# EasyEDA Pro project YT9215S-5-port-switch.epro, schematic schematic1

## Sheets
1 P1: Create Date: 2023-09-12; Page Name: P1; Project Name: 基于裕太微YT9215S的五口千兆交换机; Schematic Name: schematic1; Update Date: 2023-09-12; Company: 嘉立创EDA; Page Size: A2; Version: V1.0
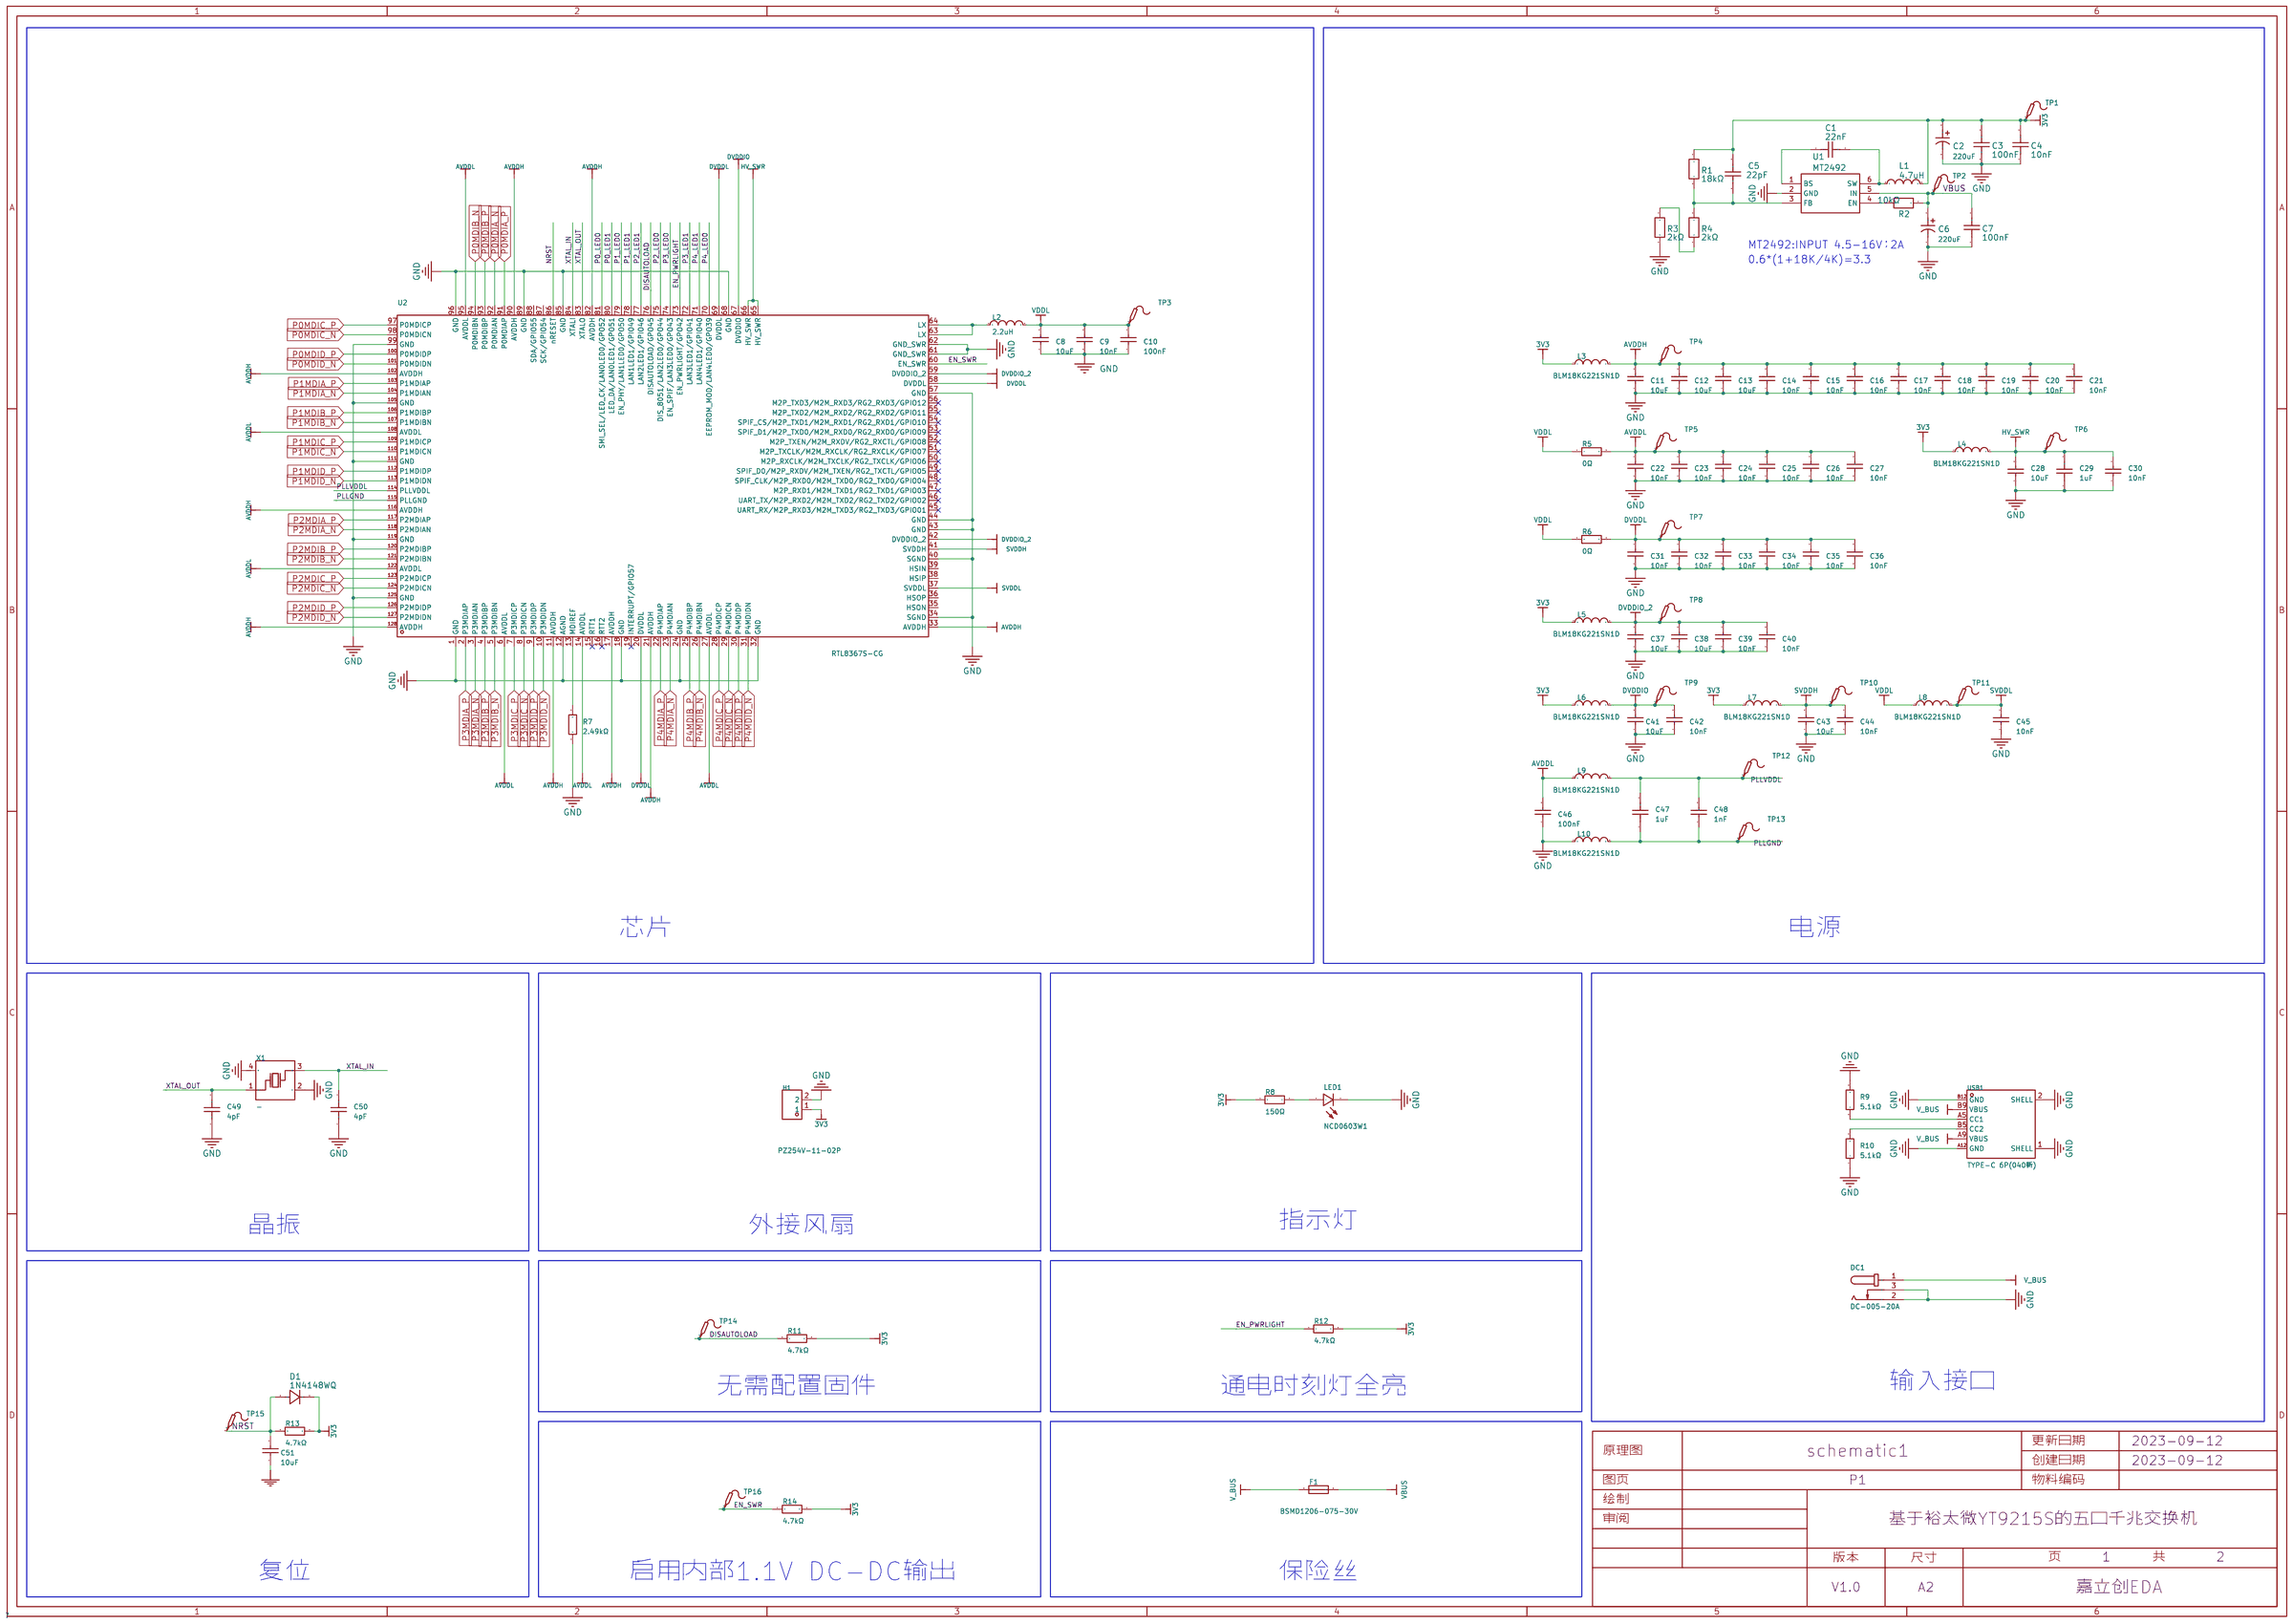
[diagram p0: P1]
2 P2: Page Name: P2
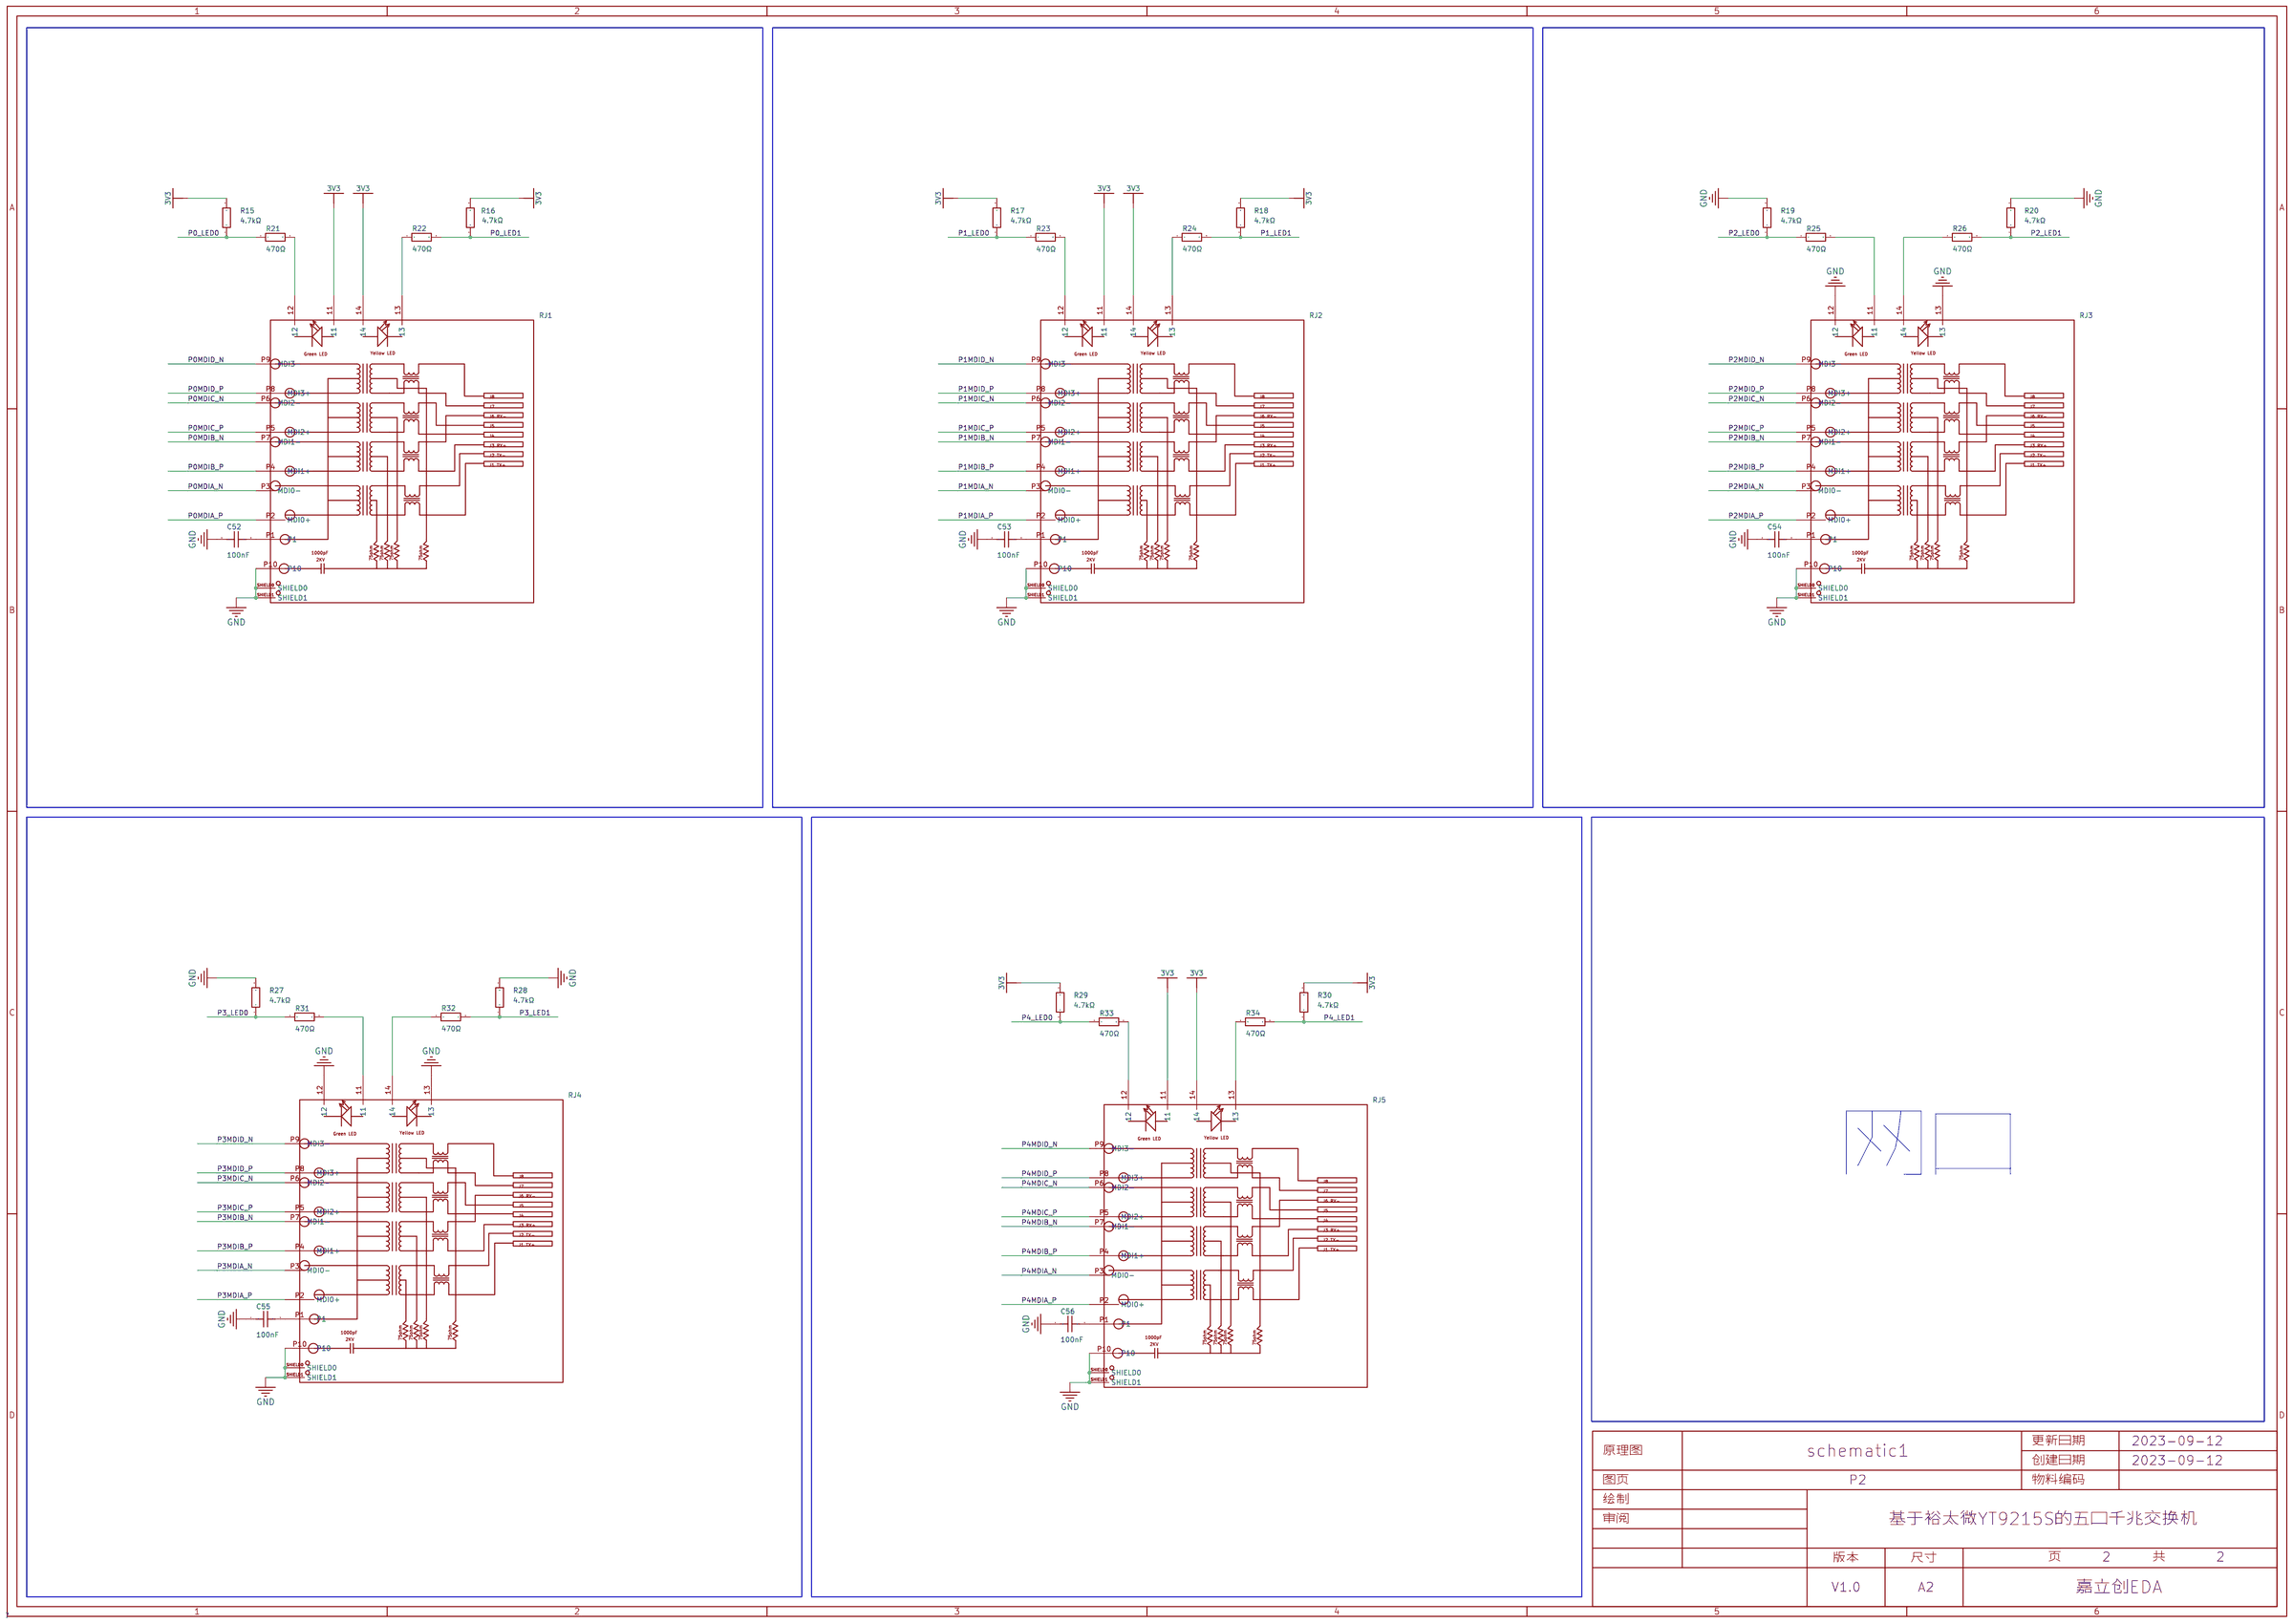
[diagram p1: P2]

## Parts
sheet P1
C1  22nF  [C0402]
C2  220uF  [CAP-SMD_BD6.3-L6.6-W6.6-LS7.4-FD]
C3  100nF  [C0402]
C4  10nF  [C0402]
C5  22pF  [C0402]
C6  220uF  [CAP-SMD_BD6.3-L6.6-W6.6-LS7.4-FD]
C7  100nF  [C0402]
C8  10uF  [C0805]
C9  10nF  [C0603]
C10  100nF  [C0603]
C11  10uF  [C0805]
C12  10uF  [C0805]
C13  10uF  [C0805]
C14  10nF  [C0603]
C15  10nF  [C0603]
C16  10nF  [C0603]
C17  10nF  [C0603]
C18  10nF  [C0603]
C19  10nF  [C0603]
C20  10nF  [C0603]
C21  10nF  [C0603]
C22  10nF  [C0603]
C23  10nF  [C0603]
C24  10nF  [C0603]
C25  10nF  [C0603]
C26  10nF  [C0603]
C27  10nF  [C0603]
C28  10uF  [C0805]
C29  1uF  [C0603]
C30  10nF  [C0603]
C31  10nF  [C0603]
C32  10nF  [C0603]
C33  10nF  [C0603]
C34  10nF  [C0603]
C35  10nF  [C0603]
C36  10nF  [C0603]
C37  10uF  [C0805]
C38  10uF  [C0805]
C39  10nF  [C0603]
C40  10nF  [C0603]
C41  10uF  [C0805]
C42  10nF  [C0603]
C43  10uF  [C0805]
C44  10nF  [C0603]
C45  10nF  [C0603]
C46  100nF  [C0603]
C47  1uF  [C0603]
C48  1nF  [C0603]
C49  4pF  [C0603]
C50  4pF  [C0603]
C51  10uF  [C0805]
D1  1N4148WQ  [SOD-123_L2.7-W1.6-LS3.7-RD-1]
DC1  DC-005-20A  [DC-IN-TH_DC-005-20A]
F1  BSMD1206-075-30V  [F1206]
H1  PZ254V-11-02P  [HDR-TH_2P-P2.54-V-M]
L1  4.7uH  [IND-SMD_L4.0-W4.0]
L2  2.2uH  [IND-SMD_L4.0-W4.0_SWPA4018S]
L3  BLM18KG221SN1D  [L0603]
L4  BLM18KG221SN1D  [L0603]
L5  BLM18KG221SN1D  [L0603]
L6  BLM18KG221SN1D  [L0603]
L7  BLM18KG221SN1D  [L0603]
L8  BLM18KG221SN1D  [L0603]
L9  BLM18KG221SN1D  [L0603]
L10  BLM18KG221SN1D  [L0603]
LED1  NCD0603W1  [LED0603-RD]
R1  18kΩ  [R0402]
R2  10kΩ  [R0402]
R3  2kΩ  [R0402]
R4  2kΩ  [R0402]
R5  0Ω  [R1206]
R6  0Ω  [R1206]
R7  2.49kΩ  [R0402]
R8  150Ω  [R0603]
R9  5.1kΩ  [R0603]
R10  5.1kΩ  [R0603]
R11  4.7kΩ  [R0603]
R12  4.7kΩ  [R0603]
R13  4.7kΩ  [R0603]
R14  4.7kΩ  [R0603]
TP1  -  [Test-Point-0.5mm]
TP2  -  [Test-Point-0.5mm]
TP3  -  [Test-Point-0.5mm]
TP4  -  [Test-Point-0.5mm]
TP5  -  [Test-Point-0.5mm]
TP6  -  [Test-Point-0.5mm]
TP7  -  [Test-Point-0.5mm]
TP8  -  [Test-Point-0.5mm]
TP9  -  [Test-Point-0.5mm]
TP10  -  [Test-Point-0.5mm]
TP11  -  [Test-Point-0.5mm]
TP12  -  [Test-Point-0.5mm]
TP13  -  [Test-Point-0.5mm]
TP14  -  [Test-Point-0.5mm]
TP15  -  [Test-Point-0.5mm]
TP16  -  [Test-Point-0.5mm]
U1  MT2492  [SOT-23-6_L2.9-W1.6-P0.95-LS2.8-BL]
U2  RTL8367S-CG  [LQFP-128_L14.0-W14.0-P0.40-LS16.0-BL]
USB1  TYPE-C 6P(040新)  [USB-C-SMD_TYPE-C-6P]
X1  -  [CRYSTAL-SMD_4P-L2.0-W1.6-BL]
sheet P2
C52  100nF  [C0402]
C53  100nF  [C0402]
C54  100nF  [C0402]
C55  100nF  [C0402]
C56  100nF  [C0402]
R15  4.7kΩ  [R0402]
R16  4.7kΩ  [R0402]
R17  4.7kΩ  [R0402]
R18  4.7kΩ  [R0402]
R19  4.7kΩ  [R0402]
R20  4.7kΩ  [R0402]
R21  470Ω  [R0402]
R22  470Ω  [R0402]
R23  470Ω  [R0402]
R24  470Ω  [R0402]
R25  470Ω  [R0402]
R26  470Ω  [R0402]
R27  4.7kΩ  [R0402]
R28  4.7kΩ  [R0402]
R29  4.7kΩ  [R0402]
R30  4.7kΩ  [R0402]
R31  470Ω  [R0402]
R32  470Ω  [R0402]
R33  470Ω  [R0402]
R34  470Ω  [R0402]
RJ1  HR911130A  [RJ45-TH_HR911130A]
RJ2  HR911130A  [RJ45-TH_HR911130A]
RJ3  HR911130A  [RJ45-TH_HR911130A]
RJ4  HR911130A  [RJ45-TH_HR911130A]
RJ5  HR911130A  [RJ45-TH_HR911130A]

## Library data of the parts
C1 = 0402B223K500NT: 容值:22nF;精度:±10%;额定电压:50V;材质(温度系数):X7R;; LCSC Part Name: 22nF ±10% 50V; Supplier Part: C1532; Manufacturer: FH(风华); Supplier Footprint: 0402; JLCPCB Part Class: Basic Part; Datasheet: https://atta.szlcsc.com/upload/public/pdf/source/20200305/C486355_26A10D38EF8C2A5C37091D0039909270.pdf; Supplier: LCSC; Tolerance: ±10%; Voltage Rated: 50V; Temperature Coefficient: X7R
C2 C6 = RVT1E221M0607: 容值:220uF;精度:±20%;额定电压:25V;纹波电流:150mA@120Hz;等效串联电阻:-;; LCSC Part Name: 220uF ±20% 25V; Supplier Part: C2918361; Manufacturer: ROQANG(容强); Supplier Footprint: SMD,D6.3xL7.7mm; JLCPCB Part Class: 扩展库; Datasheet: https://atta.szlcsc.com/upload/public/pdf/source/20211118/497C0614266278696CA52BDF245B991F.pdf; Supplier: LCSC; Tolerance: ±20%; Rated Voltage: 25V; φD: 6.3mm; L: 7.7mm; Ripple Current: 150mA@120Hz; Operating Temperature: -40℃~+105℃
C3 C7 = CL05B104KO5NNNC: 容值:100nF;精度:±10%;额定电压:16V;材质(温度系数):X7R;; LCSC Part Name: 100nF ±10% 16V; Supplier Part: C1525; Manufacturer: SAMSUNG(三星); Supplier Footprint: 0402; JLCPCB Part Class: Basic Part; Datasheet: https://atta.szlcsc.com/upload/public/pdf/source/20160103/1457707674891.pdf; Supplier: LCSC; Tolerance: ±10%; Voltage Rated: 16V; Temperature Coefficient: X7R
C4 = CL05B103KB5NNNC: 容值:10nF;精度:±10%;额定电压:50V;材质(温度系数):X7R;; LCSC Part Name: 10nF ±10% 50V; Supplier Part: C15195; Manufacturer: SAMSUNG(三星); Supplier Footprint: 0402; JLCPCB Part Class: Basic Part; Datasheet: https://atta.szlcsc.com/upload/public/pdf/source/20160103/1457707674468.pdf; Supplier: LCSC; Tolerance: ±10%; Voltage Rated: 50V; Temperature Coefficient: X7R
C5 = 0402CG220J500NT: 容值:22pF;精度:±5%;额定电压:50V;材质(温度系数):C0G;; LCSC Part Name: 22pF ±5% 50V; Supplier Part: C1555; Manufacturer: FH(风华); Supplier Footprint: 0402; JLCPCB Part Class: Basic Part; Datasheet: https://atta.szlcsc.com/upload/public/pdf/source/20200305/C486355_26A10D38EF8C2A5C37091D0039909270.pdf; Supplier: LCSC; Tolerance: ±5%; Voltage Rated: 50V; Temperature Coefficient: C0G
C8 C11-C13 C28 C37 C38 C41 C43 C51 = 0805X106K250NT: 容值:10uF;精度:±10%;额定电压:25V;材质(温度系数):X5R;; LCSC Part Name: 10uF ±10% 25V; Supplier Part: C40894; Manufacturer: FH(风华); Supplier Footprint: 0805; JLCPCB Part Class: 扩展库; Datasheet: https://atta.szlcsc.com/upload/public/pdf/source/20170923/C40894_1506149452994988759.pdf; Supplier: LCSC; Tolerance: ±10%; Voltage Rated: 25V; Temperature Coefficient: X5R
C9 C14-C27 C30-C36 C39 C40 C42 C44 C45 = 0603B103K500NT: 容值:10nF;精度:±10%;额定电压:50V;材质(温度系数):X7R;; LCSC Part Name: 10nF ±10% 50V; Supplier Part: C57112; Manufacturer: FH(风华); Supplier Footprint: 0603; JLCPCB Part Class: 基础库; Datasheet: https://atta.szlcsc.com/upload/public/pdf/source/20170923/C57112_1506149495135988846.pdf; Supplier: LCSC; Tolerance: ±10%; Voltage Rated: 50V; Temperature Coefficient: X7R
C10 C46 = 0603B104K500NT: 容值:100nF;精度:±10%;额定电压:50V;材质(温度系数):X7R;; LCSC Part Name: 100nF ±10% 50V; Supplier Part: C30926; Manufacturer: FH(风华); Supplier Footprint: 0603; JLCPCB Part Class: 扩展库; Datasheet: https://atta.szlcsc.com/upload/public/pdf/source/20170923/C30926_1506149436298988724.pdf; Supplier: LCSC; Tolerance: ±10%; Voltage Rated: 50V; Temperature Coefficient: X7R
C29 C47 = 0603B105K500NT: 温度系数:X7R;精度:±10%;额定电压:50V;容值:1uF;; LCSC Part Name: 1uF(105) ±10% 50V; Supplier Part: C90540; Manufacturer: FH(风华); Supplier Footprint: 0603; JLCPCB Part Class: 扩展库; Datasheet: https://atta.szlcsc.com/upload/public/pdf/source/20170923/C90540_1506149560830988967.pdf; Supplier: LCSC; Temperature Coefficient: X7R; Tolerance: ±10%; Voltage Rated: 50V
C48 = 0603B102K500NT: 容值:1nF;精度:±10%;额定电压:50V;材质(温度系数):X7R;; LCSC Part Name: 1nF ±10% 50V; Supplier Part: C44369; Manufacturer: FH(风华); Supplier Footprint: 0603; JLCPCB Part Class: 扩展库; Datasheet: https://atta.szlcsc.com/upload/public/pdf/source/20170923/C44369_1506149462708988780.pdf; Supplier: LCSC; Tolerance: ±10%; Voltage Rated: 50V; Temperature Coefficient: X7R
C49 C50 = 0603CG4R0B500NT: 容值:4pF;额定电压:50V;材质(温度系数):C0G;; LCSC Part Name: 4pF 50V ±0.1pF; Supplier Part: C507053; Manufacturer: FH(风华); Supplier Footprint: 0603; JLCPCB Part Class: 扩展库; Datasheet: https://atta.szlcsc.com/upload/public/pdf/source/20200305/C486355_26A10D38EF8C2A5C37091D0039909270.pdf; Supplier: LCSC; Voltage Rated: 50V; Temperature Coefficient: C0G
D1 = 1N4148WQ: LCSC Part Name: 车规级; Supplier Part: C2942441; Manufacturer: YANGJIE(扬杰); Supplier Footprint: SOD-123; JLCPCB Part Class: Extended Part; Datasheet: https://atta.szlcsc.com/upload/public/pdf/source/20220505/FBE89F3A747E9227B0A9D8340B8A7F4C.pdf; Supplier: LCSC
DC1 = DC-005-20A_C136744: 触点内径:2mm;触点外径:6.4mm;额定电流:500mA;额定电压:30V;; LCSC Part Name: DC-005-20A  内芯2.0mm 全铜; Supplier Part: C136744; Manufacturer: 韩国韩荣; Supplier Footprint: 插件; JLCPCB Part Class: 扩展库; Datasheet: https://atta.szlcsc.com/upload/public/pdf/source/20210810/D1FE451D887B1804F0660F580C4AD849.pdf; Supplier: LCSC; Inside Contact Diameter: 2mm; Outside Contact Diameter: 6.4mm; Current Rating (Max): 500mA; Voltage Rating (Max): 30V
F1 = BSMD1206-075-30V: 最大电压:30V;最大电流:40A;保持电流:750mA;跳闸电流:1.5A;消耗功率:600mW;初始态阻值(最小值):90mΩ;跳断后阻值(最大值):500mΩ;最大动作时间:200ms;工作温度:-40℃~+85℃;; LCSC Part Name: 1206 0.75A 30V 佰宏高电压; Supplier Part: C976305; Manufacturer: BHFUSE(佰宏); Supplier Footprint: 1206; JLCPCB Part Class: 扩展库; Datasheet: https://atta.szlcsc.com/upload/public/pdf/source/20220607/BE3D288249A8A8FEF08AA69BF9FC830E.pdf; Supplier: LCSC; Operating Voltage (Max): 30V; Current Rating (Max): 40A; Hold Current: 750mA; Trip Current: 1.5A; Power Dissipation: 600mW; Resistance - Initial (Ri) (Min): 90mΩ; Resistance - Post Trip (R1) (Max): 500mΩ; Maximum Time to Trip: 200ms; Operating Temperature: -40℃~+85℃
H1 = PZ254V-11-02P: 排数:单排;总PIN位数:2P;间距:2.54mm;插针结构:1x2P;行距:-;安装类型:直插;圆针/方针:方针;额定电流:-;额定电压:-;配合针长度:6mm;塑高:2.5mm;端接针长度:3mm;触头材质:黄铜;触头镀层:-;工作温度范围:-40℃~+105℃;颜色:黑色;; LCSC Part Name: 2.54mm 1x2P 直插 方针; Supplier Part: C492401; Manufacturer: XFCN(兴飞); Supplier Footprint: 插件,P=2.54mm; JLCPCB Part Class: 扩展库; Datasheet: https://atta.szlcsc.com/upload/public/pdf/source/20200309/C492401_A812433581A9B211A7FFA413ADDFF0E5.pdf; Supplier: LCSC; Number of Rows: 单排; Number of Pins: 2P; Pitch: 2.54mm; Pin Structure: 1x2P; Mounting Type: 直插; Circluar Pins/Square Pins: 方针; Length of Mating Pin: 6mm; Insulation Height: 2.5mm; Length of End Connection Pin: 3mm; Contact Material: 黄铜; Operating Temperature Range: -40℃~+105℃; Color: 黑色
L1 = SWPA4030S4R7MT: 直流电阻(DCR):78mΩ;精度:±20%;电感值:4.7uH;额定电流:2A;; LCSC Part Name: 4.7uH ±20%; Supplier Part: C57269; Manufacturer: Sunlord(顺络); Supplier Footprint: SMD; JLCPCB Part Class: Extended Part; Datasheet: https://atta.szlcsc.com/upload/public/pdf/source/20161024/1477287957557.pdf; Supplier: LCSC; DC Resistance (DCR): 78mΩ; Tolerance: ±20%; Height: 3mm; Width: 4mm; Rated Current: 2A; Length: 4mm
L2 = SWPA4018S2R2MT: 类型:-;电感值:2.2uH;精度:±20%;额定电流:1.65A;饱和电流(Isat):3.2A;; LCSC Part Name: 2.2uH ±20% 3.2A; Supplier Part: C50543; Manufacturer: Sunlord(顺络); Supplier Footprint: SMD; JLCPCB Part Class: 扩展库; Datasheet: https://atta.szlcsc.com/upload/public/pdf/source/20210916/AC798BA7E846B7D0B6818F45CD84DB0B.pdf; Supplier: LCSC; Tolerance: ±20%; Rated Current: 1.65A; Saturation Current (Isat): 3.2A; DC Resistance (DCR): 45mΩ
L3-L10 = BLM18KG221SN1D: 标称阻抗@测试频率:220Ω@100MHz;误差:±25%;直流电阻(RDC):50mΩ;; LCSC Part Name: 单路 0603磁珠 阻抗220Ω@100MHz; Supplier Part: C88980; Manufacturer: muRata(村田); Supplier Footprint: 0603; JLCPCB Part Class: 扩展库; Datasheet: https://atta.szlcsc.com/upload/public/pdf/source/20180326/C88980_2C536F2328F49D4DFD71B8DED243E2BA.pdf; Supplier: LCSC; Impedance @ Frequency: 220Ω@100MHz; Tolerance: ±25%; DC Resistance: 50mΩ; Current Rating: 2.2A; Circuits: 1
LED1 = NCD0603W1: 发光颜色:白灯;; Supplier Part: C84265; Manufacturer: 国星光电; Supplier Footprint: 0603; JLCPCB Part Class: 扩展库; Datasheet: https://atta.szlcsc.com/upload/public/pdf/source/20200820/C84265_479E6193713348A548E5CD6D9278BF16.pdf; Supplier: LCSC; Emitted Color: 白灯
R1 = 0402WGF1802TCE: 电阻类型:厚膜电阻;阻值:18kΩ;精度:±1%;功率:62.5mW;; LCSC Part Name: 18kΩ ±1% 62.5mW; Supplier Part: C25762; Manufacturer: UNI-ROYAL(厚声); Supplier Footprint: 0402; JLCPCB Part Class: Basic Part; Datasheet: https://atta.szlcsc.com/upload/public/pdf/source/20200306/C422600_1E6D84923E4A46A82E41ADD87F860B5C.pdf; Supplier: LCSC; Type: 厚膜电阻; Tolerance: ±1%; Power(Watts): 62.5mW; Temperature Coefficient: ±100ppm/℃; Overload Voltage (Max): 50V; Operating Temperature Range: -55℃~+155℃
R2 = 0402WGF1002TCE: 电阻类型:厚膜电阻;阻值:10kΩ;精度:±1%;功率:62.5mW;; LCSC Part Name: 10kΩ ±1% 62.5mW; Supplier Part: C25744; Manufacturer: UNI-ROYAL(厚声); Supplier Footprint: 0402; JLCPCB Part Class: Basic Part; Datasheet: https://atta.szlcsc.com/upload/public/pdf/source/20200306/C422600_1E6D84923E4A46A82E41ADD87F860B5C.pdf; Supplier: LCSC; Type: 厚膜电阻; Tolerance: ±1%; Power(Watts): 62.5mW; Temperature Coefficient: ±100ppm/℃; Overload Voltage (Max): 50V; Operating Temperature Range: -55℃~+155℃
R3 R4 = 0402WGF2001TCE: 电阻类型:厚膜电阻;阻值:2kΩ;精度:±1%;功率:62.5mW;; LCSC Part Name: 2kΩ ±1% 62.5mW; Supplier Part: C4109; Manufacturer: UNI-ROYAL(厚声); Supplier Footprint: 0402; JLCPCB Part Class: Basic Part; Datasheet: https://atta.szlcsc.com/upload/public/pdf/source/20200306/C422600_1E6D84923E4A46A82E41ADD87F860B5C.pdf; Supplier: LCSC; Type: 厚膜电阻; Tolerance: ±1%; Power(Watts): 62.5mW; Temperature Coefficient: ±100ppm/℃; Overload Voltage (Max): 50V; Operating Temperature Range: -55℃~+155℃
R5 R6 = RS-06000JT: 阻值:0Ω;精度:±5%;功率:250mW;; LCSC Part Name: 0Ω ±5% 250mW; Supplier Part: C115323; Manufacturer: FH(风华); Supplier Footprint: 1206; JLCPCB Part Class: 扩展库; Datasheet: https://atta.szlcsc.com/upload/public/pdf/source/20170628/1498638561272.pdf; Supplier: LCSC; Tolerance: ±5%; Power(Watts): 250mW; Overload Voltage (Max): 200V; Operating Temperature Range: -55℃~+155℃
R7 = RC0402FR-072K49L: 电阻类型:厚膜电阻;阻值:2.49kΩ;精度:±1%;功率:62.5mW;; LCSC Part Name: 厚膜电阻 2.49kΩ ±1% 62.5mW; Supplier Part: C145071; Manufacturer: YAGEO(国巨); Supplier Footprint: 0402; JLCPCB Part Class: 扩展库; Datasheet: https://atta.szlcsc.com/upload/public/pdf/source/20171221/C145071_15138311814201195405.pdf; Supplier: LCSC; Type: 厚膜电阻; Tolerance: ±1%; Power(Watts): 62.5mW; Temperature Coefficient: ±100ppm/℃; Overload Voltage (Max): 50V; Operating Temperature Range: -55℃~+155℃
R8 = 0603WAF1500T5E: 电阻类型:厚膜电阻;阻值:150Ω;精度:±1%;功率:100mW;; LCSC Part Name: 150Ω ±1% 100mW; Supplier Part: C22808; Manufacturer: UNI-ROYAL(厚声); Supplier Footprint: 0603; JLCPCB Part Class: 基础库; Datasheet: https://atta.szlcsc.com/upload/public/pdf/source/20200306/C422600_1E6D84923E4A46A82E41ADD87F860B5C.pdf; Supplier: LCSC; Type: 厚膜电阻; Tolerance: ±1%; Power(Watts): 100mW; Temperature Coefficient: ±100ppm/℃; Overload Voltage (Max): 75V; Operating Temperature Range: -55℃~+155℃
R9 R10 = 0603WAF5101T5E: 电阻类型:厚膜电阻;阻值:5.1kΩ;精度:±1%;功率:100mW;; LCSC Part Name: 5.1kΩ ±1% 100mW; Supplier Part: C23186; Manufacturer: UNI-ROYAL(厚声); Supplier Footprint: 0603; JLCPCB Part Class: 基础库; Datasheet: https://atta.szlcsc.com/upload/public/pdf/source/20200306/C422600_1E6D84923E4A46A82E41ADD87F860B5C.pdf; Supplier: LCSC; Type: 厚膜电阻; Tolerance: ±1%; Power(Watts): 100mW; Temperature Coefficient: ±100ppm/℃; Overload Voltage (Max): 75V; Operating Temperature Range: -55℃~+155℃
R11-R14 = 0603WAF4701T5E: 电阻类型:厚膜电阻;阻值:4.7kΩ;精度:±1%;功率:100mW;; LCSC Part Name: 4.7kΩ ±1% 100mW; Supplier Part: C23162; Manufacturer: UNI-ROYAL(厚声); Supplier Footprint: 0603; JLCPCB Part Class: 基础库; Datasheet: https://atta.szlcsc.com/upload/public/pdf/source/20200306/C422600_1E6D84923E4A46A82E41ADD87F860B5C.pdf; Supplier: LCSC; Type: 厚膜电阻; Tolerance: ±1%; Power(Watts): 100mW; Temperature Coefficient: ±100ppm/℃; Overload Voltage (Max): 75V; Operating Temperature Range: -55℃~+155℃
TP1-TP16 = Test-Point: Test Point 测试点; Check: false
U1 = MT2492: 功能类型:降压型;同步整流:-;输出通道数:-;拓扑结构:-;输入电压:-;输出电流(最大值):-;开关频率:-;; LCSC Part Name: 降压型; Supplier Part: C89358; Manufacturer: 西安航天民芯; Supplier Footprint: SOT-23-6; JLCPCB Part Class: Extended Part; Datasheet: https://atta.szlcsc.com/upload/public/pdf/source/20221209/5C81DA9662873D3A116170FFBF63E49D.pdf; Supplier: LCSC; Function: 降压型
U2 = RTL8367S-CG: 应用功能:-;通道数:-;接口类型:-;; LCSC Part Name: 二层管理5+2端口10/100/1000M交换机控制器; Supplier Part: C2760849; Manufacturer: REALTEK(瑞昱); Supplier Footprint: LQFP-128(14x14); JLCPCB Part Class: Extended Part; Supplier: LCSC
USB1 = TYPE-C 6P(040新): 连接器类型:Type-C;标准:-;公母:母座;触点数量:6P;端口数量:1;安装方式:卧贴;额定电流 - 电源:3A;工作温度范围:-40℃~+85℃;; LCSC Part Name: Type-C 母座 卧贴 外壳带丝印; Supplier Part: C2887422; Manufacturer: SHOU HAN(首韩); Supplier Footprint: SMD; JLCPCB Part Class: 扩展库; Datasheet: https://atta.szlcsc.com/upload/public/pdf/source/20210820/A6D4675B44FEA528A0512D7C06DEA92E.pdf; Supplier: LCSC; Connector Type: Type-C; Gender: 母座; Number of Contacts: 6P; Number of Ports: 1; Mounting Style: 卧贴; Current Rating - Power (Max): 3A; Operating Temperature Range: -40℃~+85℃
X1 = XRCGB25M000F3M00R0: 频率:-;负载电容:-;; Supplier Part: C127893; Manufacturer: muRata(村田); Supplier Footprint: SMD2016-4P; JLCPCB Part Class: Extended Part; Datasheet: https://atta.szlcsc.com/upload/public/pdf/source/20170914/C127893_1505359425389967708.pdf; Supplier: LCSC
C52-C56 = FN15X104K250PNG: 容值:100nF;精度:±10%;额定电压:25V;材质(温度系数):X7R;; LCSC Part Name: 100nF ±10% 25V; Supplier Part: C525225; Manufacturer: PSA(信昌电陶); Supplier Footprint: 0402; JLCPCB Part Class: Extended Part; Datasheet: https://atta.szlcsc.com/upload/public/pdf/source/20200506/C436246_4EAA78C9048D88437BAF2CB7B8BE45FD.pdf; Supplier: LCSC; Tolerance: ±10%; Voltage Rated: 25V; Temperature Coefficient: X7R
R15-R20 R27-R30 = 0402WGF4701TCE: 电阻类型:厚膜电阻;阻值:4.7kΩ;精度:±1%;功率:62.5mW;; LCSC Part Name: 4.7kΩ ±1% 62.5mW; Supplier Part: C25900; Manufacturer: UNI-ROYAL(厚声); Supplier Footprint: 0402; JLCPCB Part Class: Basic Part; Datasheet: https://atta.szlcsc.com/upload/public/pdf/source/20200306/C422600_1E6D84923E4A46A82E41ADD87F860B5C.pdf; Supplier: LCSC; Type: 厚膜电阻; Tolerance: ±1%; Power(Watts): 62.5mW; Temperature Coefficient: ±100ppm/℃; Overload Voltage (Max): 50V; Operating Temperature Range: -55℃~+155℃
R21-R26 R31-R34 = 0402WGF4700TCE: 电阻类型:厚膜电阻;阻值:470Ω;精度:±1%;功率:62.5mW;; LCSC Part Name: 470Ω ±1% 62.5mW; Supplier Part: C25117; Manufacturer: UNI-ROYAL(厚声); Supplier Footprint: 0402; JLCPCB Part Class: Basic Part; Datasheet: https://atta.szlcsc.com/upload/public/pdf/source/20200306/C422600_1E6D84923E4A46A82E41ADD87F860B5C.pdf; Supplier: LCSC; Type: 厚膜电阻; Tolerance: ±1%; Power(Watts): 62.5mW; Temperature Coefficient: ±100ppm/℃; Overload Voltage (Max): 50V; Operating Temperature Range: -55℃~+155℃
RJ1-RJ5 = HR911130A: 连接器类型:插座;USOC代码:RJ45;端口数量:1;等级:-;屏蔽:-;LED:有;; Supplier Part: C54408; Manufacturer: HANRUN(汉仁); Supplier Footprint: Through Hole; JLCPCB Part Class: Extended Part; Datasheet: 2022-01-08/236921A/bb93d1b97a1c43f7a2520317d0b76856/C54408_RJ45_2015-10-14.PDF; Supplier: LCSC; Connector Type: 插座; USOC Codes: RJ45; Number of Ports: 1; LED: 有

## Nets
3V3: C2.1 C3.2 C4.2 C5.1 D1.1(K) H1.1 L1.2 L3.1 L4.1 L5.1 L6.1 L7.1 R1.1 R8.1 R11.2 R12.2 R13.2 R14.2 R15.2 R16.2 R17.2 R18.2 R29.2 R30.2 RJ1.11 RJ1.14 RJ2.11 RJ2.14 RJ5.11 RJ5.14 TP1.1
AVDDH: C11.2 C12.2 C13.2 C14.2 C15.2 C16.2 C17.2 C18.2 C19.2 C20.2 C21.2 L3.2 TP4.1 U2.11(AVDDH) U2.17(AVDDH) U2.21(AVDDH) U2.33(AVDDH) U2.82(AVDDH) U2.90(AVDDH) U2.102(AVDDH) U2.116(AVDDH) U2.128(AVDDH)
AVDDL: C22.2 C23.2 C24.2 C25.2 C26.2 C27.2 C46.2 L9.1 R5.2 TP5.1 U2.6(AVDDL) U2.14(AVDDL) U2.27(AVDDL) U2.95(AVDDL) U2.108(AVDDL) U2.122(AVDDL)
DVDDIO: C41.2 C42.2 L6.2 TP9.1 U2.67(DVDDIO)
DVDDIO_2: C37.2 C38.2 C39.2 C40.2 L5.2 TP8.1 U2.42(DVDDIO_2) U2.59(DVDDIO_2)
DVDDL: C31.2 C32.2 C33.2 C34.2 C35.2 C36.2 R6.2 TP7.1 U2.20(DVDDL) U2.58(DVDDL) U2.69(DVDDL)
GND: C2.2 C3.1 C4.1 C6.2 C7.1 C8.1 C9.1 C10.1 C11.1 C12.1 C13.1 C14.1 C15.1 C16.1 C17.1 C18.1 C19.1 C20.1 C21.1 C22.1 C23.1 C24.1 C25.1 C26.1 C27.1 C28.1 C29.1 C30.1 C31.1 C32.1 C33.1 C34.1 C35.1 C36.1 C37.1 C38.1 C39.1 C40.1 C41.1 C42.1 C43.1 C44.1 C45.1 C46.1 C49.1 C50.1 C51.1 C52.1 C53.1 C54.1 C55.1 C56.1 DC1.2 DC1.3 H1.2 L10.1 LED1.1(-) R3.2 R7.1 R9.2 R10.1 R19.2 R20.2 R27.2 R28.2 RJ1.P10 RJ1.SHIELD0 RJ1.SHIELD1 RJ2.P10 RJ2.SHIELD0 RJ2.SHIELD1 RJ3.12 RJ3.13 RJ3.P10 RJ3.SHIELD0 RJ3.SHIELD1 RJ4.12 RJ4.13 RJ4.P10 RJ4.SHIELD0 RJ4.SHIELD1 RJ5.P10 RJ5.SHIELD0 RJ5.SHIELD1 U1.2(GND) U2.1(GND) U2.12(AGND) U2.18(GND) U2.24(GND) U2.32(GND) U2.34(SGND) U2.40(SGND) U2.43(GND) U2.44(GND) U2.57(GND) U2.61(GND_SWR) U2.62(GND_SWR) U2.68(GND) U2.85(GND) U2.89(GND) U2.96(GND) U2.99(GND) U2.105(GND) U2.111(GND) U2.119(GND) U2.125(GND) USB1.1(SHELL) USB1.2(SHELL) USB1.A12(GND) USB1.B12(GND) X1.2(GND) X1.4(GND)
SVDDH: C43.2 C44.2 L7.2 TP10.1 U2.41(SVDDH)
SVDDL: C45.2 L8.2 TP11.1 U2.37(SVDDL)
VBUS: C6.1 C7.2 F1.2 R2.1 TP2.1 U1.5(IN)
VDDL: C8.2 C9.2 C10.2 L2.2 L8.1 R5.1 R6.1 TP3.1
DISAUTOLOAD: R11.1 TP14.1 U2.76(DISAUTOLOAD/GPO45)
EN_PWRLIGHT: R12.1 U2.73(EN_PWRLIGHT/GPO42)
EN_SWR: R14.1 TP16.1 U2.60(EN_SWR)
HV_SWR: C28.2 C29.2 C30.2 L4.2 TP6.1 U2.65(HV_SWR) U2.66(HV_SWR)
NRST: C51.2 D1.2(A) R13.1 TP15.1 U2.86(nRESET)
P0_LED0: R15.1 R21.1 U2.81(SMI_SEL/LED_CK/LAN0LED0/GPO52)
P0_LED1: R16.1 R22.2 U2.80(LED_DA/LAN0LED1/GPO51)
P0MDIA_N: RJ1.P3(MDI0-) U2.92(P0MDIAN)
P0MDIA_P: RJ1.P2(MDI0+) U2.91(P0MDIAP)
P0MDIB_N: RJ1.P7(MDI1-) U2.94(P0MDIBN)
P0MDIB_P: RJ1.P4(MDI1+) U2.93(P0MDIBP)
P0MDIC_N: RJ1.P6(MDI2-) U2.98(P0MDICN)
P0MDIC_P: RJ1.P5(MDI2+) U2.97(P0MDICP)
P0MDID_N: RJ1.P9(MDI3-) U2.101(P0MDIDN)
P0MDID_P: RJ1.P8(MDI3+) U2.100(P0MDIDP)
P1_LED0: R17.1 R23.1 U2.79(EN_PHY/LAN1LED0/GPO50)
P1_LED1: R18.1 R24.2 U2.78(LAN1LED1/GPIO49)
P1MDIA_N: RJ2.P3(MDI0-) U2.104(P1MDIAN)
P1MDIA_P: RJ2.P2(MDI0+) U2.103(P1MDIAP)
P1MDIB_N: RJ2.P7(MDI1-) U2.107(P1MDIBN)
P1MDIB_P: RJ2.P4(MDI1+) U2.106(P1MDIBP)
P1MDIC_N: RJ2.P6(MDI2-) U2.110(P1MDICN)
P1MDIC_P: RJ2.P5(MDI2+) U2.109(P1MDICP)
P1MDID_N: RJ2.P9(MDI3-) U2.113(P1MDIDN)
P1MDID_P: RJ2.P8(MDI3+) U2.112(P1MDIDP)
P2_LED0: R19.1 R25.1 U2.75(DIS_8051/LAN2LED0/GPO44)
P2_LED1: R20.1 R26.2 U2.77(LAN2LED1/GPIO46)
P2MDIA_N: RJ3.P3(MDI0-) U2.118(P2MDIAN)
P2MDIA_P: RJ3.P2(MDI0+) U2.117(P2MDIAP)
P2MDIB_N: RJ3.P7(MDI1-) U2.121(P2MDIBN)
P2MDIB_P: RJ3.P4(MDI1+) U2.120(P2MDIBP)
P2MDIC_N: RJ3.P6(MDI2-) U2.124(P2MDICN)
P2MDIC_P: RJ3.P5(MDI2+) U2.123(P2MDICP)
P2MDID_N: RJ3.P9(MDI3-) U2.127(P2MDIDN)
P2MDID_P: RJ3.P8(MDI3+) U2.126(P2MDIDP)
P3_LED0: R27.1 R31.1 U2.74(EN_SPIF/LAN3LED0/GPO43)
P3_LED1: R28.1 R32.2 U2.72(LAN3LED1/GPIO41)
P3MDIA_N: RJ4.P3(MDI0-) U2.3(P3MDIAN)
P3MDIA_P: RJ4.P2(MDI0+) U2.2(P3MDIAP)
P3MDIB_N: RJ4.P7(MDI1-) U2.5(P3MDIBN)
P3MDIB_P: RJ4.P4(MDI1+) U2.4(P3MDIBP)
P3MDIC_N: RJ4.P6(MDI2-) U2.8(P3MDICN)
P3MDIC_P: RJ4.P5(MDI2+) U2.7(P3MDICP)
P3MDID_N: RJ4.P9(MDI3-) U2.10(P3MDIDN)
P3MDID_P: RJ4.P8(MDI3+) U2.9(P3MDIDP)
P4_LED0: R29.1 R33.1 U2.70(EEPROM_MOD/LAN4LED0/GPO39)
P4_LED1: R30.1 R34.2 U2.71(LAN4LED1/GPIO40)
P4MDIA_N: RJ5.P3(MDI0-) U2.23(P4MDIAN)
P4MDIA_P: RJ5.P2(MDI0+) U2.22(P4MDIAP)
P4MDIB_N: RJ5.P7(MDI1-) U2.26(P4MDIBN)
P4MDIB_P: RJ5.P4(MDI1+) U2.25(P4MDIBP)
P4MDIC_N: RJ5.P6(MDI2-) U2.29(P4MDICN)
P4MDIC_P: RJ5.P5(MDI2+) U2.28(P4MDICP)
P4MDID_N: RJ5.P9(MDI3-) U2.31(P4MDIDN)
P4MDID_P: RJ5.P8(MDI3+) U2.30(P4MDIDP)
PLLGND: C47.1 C48.1 L10.2 TP13.1 U2.115(PLLGND)
PLLVDDL: C47.2 C48.2 L9.2 TP12.1 U2.114(PLLVDDL)
V_BUS: DC1.1 F1.1 USB1.A9(VBUS) USB1.B9(VBUS)
XTAL_IN: C50.2 U2.84(XTALI) X1.3(OSC2)
XTAL_OUT: C49.2 U2.83(XTALO) X1.1(OSC1)
$1N2005: R7.2 U2.13(MDIREF)
$1N2999: L2.1 U2.63(LX) U2.64(LX)
$1N4938: R3.1 R4.2
$1N4945: C5.2 R1.2 R4.1 U1.3(FB)
$1N4947: R2.2 U1.4(EN)
$1N4948: C1.1 U1.1(BS)
$1N4949: C1.2 L1.1 U1.6(SW)
$1N9816: R9.1 USB1.A5(CC1)
$1N9819: R10.2 USB1.B5(CC2)
$1N10186: LED1.2(+) R8.2
$2N645: R21.2 RJ1.12
$2N647: R22.1 RJ1.13
$2N653: C52.2 RJ1.P1
$2N1076: R23.2 RJ2.12
$2N1078: R24.1 RJ2.13
$2N1084: C53.2 RJ2.P1
$2N1523: C54.2 RJ3.P1
$2N1954: C55.2 RJ4.P1
$2N2377: R33.2 RJ5.12
$2N2379: R34.1 RJ5.13
$2N2385: C56.2 RJ5.P1
$2N6448: R25.2 RJ3.11
$2N6531: R31.2 RJ4.11
$2N6555: R26.1 RJ3.14
$2N6593: R32.1 RJ4.14

Not connected (* = marked no-connect by the designer): U2 15(RTT1)* 16(RTT2)* 19(INTERRUPT/GPIO57)* 35(HSON) 36(HSOP) 38(HSIP) 39(HSIN) 45(UART_RX/M2P_RXD3/M2M_TXD3/RG2_TXD3/GPIO01)* 46(UART_TX/M2P_RXD2/M2M_TXD2/RG2_TXD2/GPIO02)* 47(M2P_RXD1/M2M_TXD1/RG2_TXD1/GPIO03)* 48(SPIF_CLK/M2P_RXD0/M2M_TXD0/RG2_TXD0/GPIO04)* 49(SPIF_D0/M2P_RXDV/M2M_TXEN/RG2_TXCTL/GPIO05)* 50(M2P_RXCLK/M2M_TXCLK/RG2_TXCLK/GPIO06)* 51(M2P_TXCLK/M2M_RXCLK/RG2_RXCLK/GPIO07)* 52(M2P_TXEN/M2M_RXDV/RG2_RXCTL/GPIO08)* 53(SPIF_D1/M2P_TXD0/M2M_RXD0/RG2_RXD0/GPIO09)* 54(SPIF_CS/M2P_TXD1/M2M_RXD1/RG2_RXD1/GPIO10)* 55(M2P_TXD2/M2M_RXD2/RG2_RXD2/GPIO11)* 56(M2P_TXD3/M2M_RXD3/RG2_RXD3/GPIO12)* 87(SCK/GPIO54) 88(SDA/GPIO55)

## Notes on the sheets
sheet 1
- MT2492:INPUT 4.5-16V；2A
- 0.6*(1+18K/4K)=3.3
- 芯片
- 电源
- 晶振
- 外接风扇
- 指示灯
- 无需配置固件
- 通电时刻灯全亮
- 输入接口
- 复位
- 启用内部1.1V DC-DC输出
- 保险丝
sheet 2
- 网口
